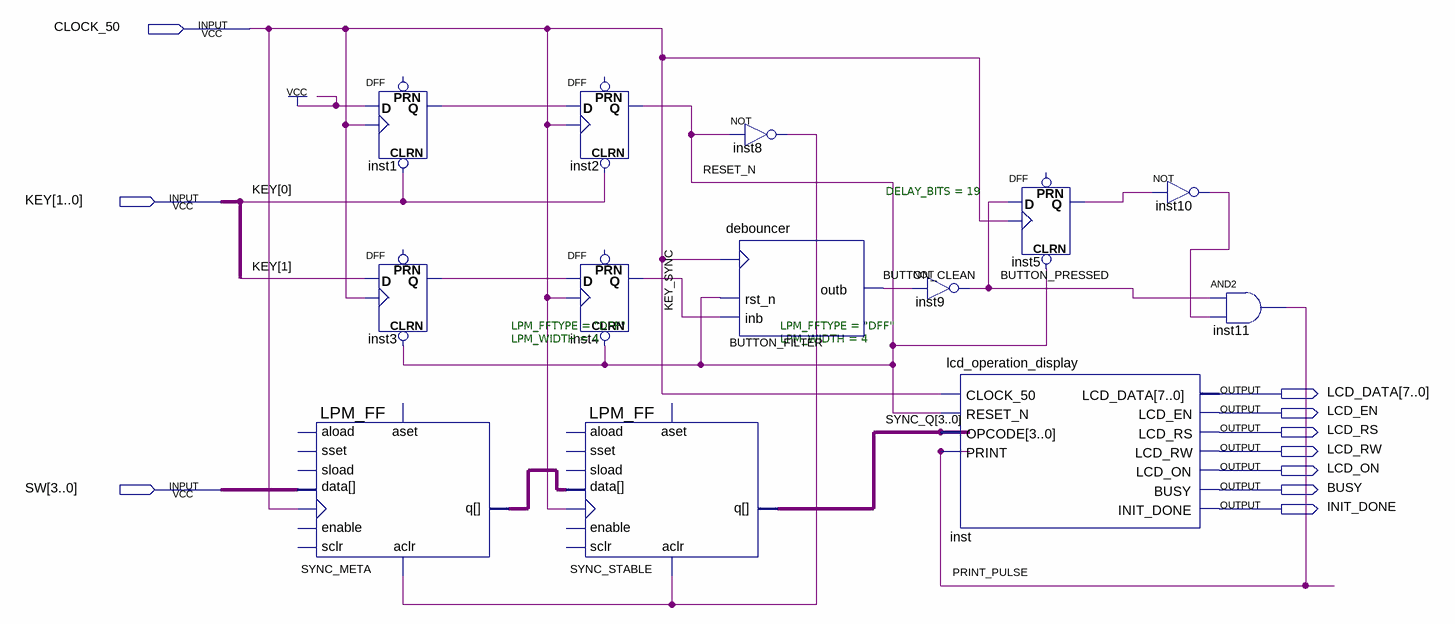
[diagram p0: schematic sheet]
// Quartus schematic lcd_de2_115_top.bdf as structural Verilog: 13 symbols, 10 pins
module lcd_de2_115_top (
  input  CLOCK_50,
  input  [1:0] KEY,
  input  [3:0] SW,
  output [7:0] LCD_DATA,
  output LCD_EN,
  output LCD_RS,
  output LCD_RW,
  output LCD_ON,
  output BUSY,
  output INIT_DONE
);

  wire BUTTON_CLEAN, BUTTON_PRESSED, inst1_q, inst3_q, inst5_q, inst8_out, inst10_out, KEY_SYNC, PRINT_PULSE,
       RESET_N;
  wire [3:0] SYNC_META_q, SYNC_Q;

  LPM_FF #(.LPM_FFTYPE("DFF"), .LPM_WIDTH(4)) SYNC_META (
    .clock(CLOCK_50), .aclr(inst8_out), .data(SW), .q(SYNC_META_q));  // open: enable, aload, sset, sload, aset, sclr
  DFF inst1 (.CLRN(KEY[0]), .CLK(CLOCK_50), .D(1'b1), .Q(inst1_q));  // open: PRN
  DFF inst3 (.CLRN(RESET_N), .CLK(CLOCK_50), .D(KEY[1]), .Q(inst3_q));  // open: PRN
  DFF inst2 (.CLRN(KEY[0]), .CLK(CLOCK_50), .D(inst1_q), .Q(RESET_N));  // open: PRN
  DFF inst4 (.CLRN(RESET_N), .CLK(CLOCK_50), .D(inst3_q), .Q(KEY_SYNC));  // open: PRN
  LPM_FF #(.LPM_FFTYPE("DFF"), .LPM_WIDTH(4)) SYNC_STABLE (
    .clock(CLOCK_50), .aclr(inst8_out), .data(SYNC_META_q), .q(SYNC_Q));  // open: enable, aload, sset, sload, aset, sclr
  debouncer #(.DELAY_BITS(19)) BUTTON_FILTER (.rst_n(RESET_N), .inb(KEY_SYNC), .clk(CLOCK_50), .outb(BUTTON_CLEAN));
  not inst8 (inst8_out, RESET_N);
  not inst9 (BUTTON_PRESSED, BUTTON_CLEAN);
  lcd_operation_display inst (
    .CLOCK_50(CLOCK_50), .RESET_N(RESET_N), .OPCODE(SYNC_Q), .PRINT(PRINT_PULSE), .LCD_DATA(LCD_DATA),
    .LCD_EN(LCD_EN), .LCD_RS(LCD_RS), .LCD_RW(LCD_RW), .LCD_ON(LCD_ON), .BUSY(BUSY), .INIT_DONE(INIT_DONE));
  DFF inst5 (.CLRN(RESET_N), .CLK(CLOCK_50), .D(BUTTON_PRESSED), .Q(inst5_q));  // open: PRN
  not inst10 (inst10_out, inst5_q);
  and inst11 (PRINT_PULSE, BUTTON_PRESSED, inst10_out);
endmodule
